# Altium schematic sheet EEPROM.SchDoc: EEPROM
size A4; DocumentNumber: 13; SheetNumber: 11; SheetTotal: 16
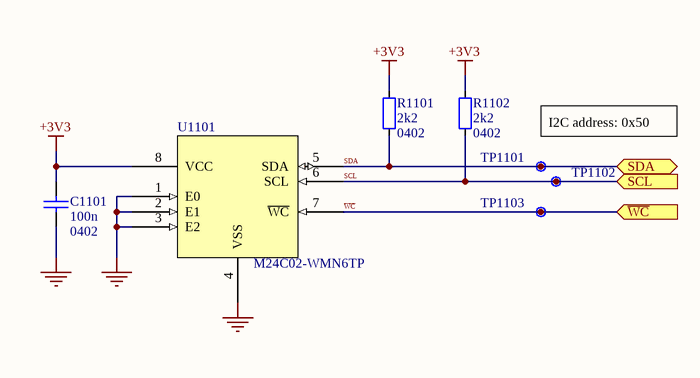
[diagram p0: EEPROM.SchDoc]

## Parts
C1101  100n  Footprint: 0402  [CAP_0402_B]
R1101  2k2  Footprint: 0402  [RES_0402_A]
R1102  2k2  Footprint: 0402  [RES_0402_A]
TP1101  Net  [Unlabelled Testpoint]  (value not drawn)
TP1102  Net  [Unlabelled Testpoint]  (value not drawn)
TP1103  Net  [Unlabelled Testpoint]  (value not drawn)
U1101  M24C02-WMN6TP  [M24C02-WMN6TP]

## Ports
SCL (in, see Top_Level[3D]), SDA (bidir, see Top_Level[3D]), ~{WC} (in, see Top_Level[3D])

## Nets
+3V3: C1101.1 R1101.1(a) R1102.1(a) U1101.8(VCC)
GND: C1101.2 U1101.1(E0) U1101.2(E1) U1101.3(E2) U1101.4(VSS)
SCL: R1102.2(a) TP1102.1 U1101.6(SCL) ; port SCL
SDA: R1101.2(a) TP1101.1 U1101.5(SDA) ; port SDA
~{WC}: TP1103.1 U1101.7(~{WC}) ; port ~{WC}

## Notes on the sheet
- I2C address: 0x50

## Library data of the parts
C1101 = CAP_0402: 0402 SMD Capacitor
R1101 R1102 = RES_0402: 0402 SMD Resistor
TP1101-TP1103 = Unlabelled Testpoint: Symbol for an unlabelled testpoint
U1101 = M24C02-WMN6TP: IC EEPROM 2KBIT I2C 400KHZ 8SOIC; Supplier 1: Arrow Electronics; Supplier Part Number 1: M24C02-WMN6TP